# Altium schematic sheet [1] Conn_SODIMM.SchDoc
size A2 portrait; Organization: Altium Limited; Address1: L3, 12a Rodborough Rd; Address2: Frenchs Forest; Address3: NSW; Address4: Australia 2086
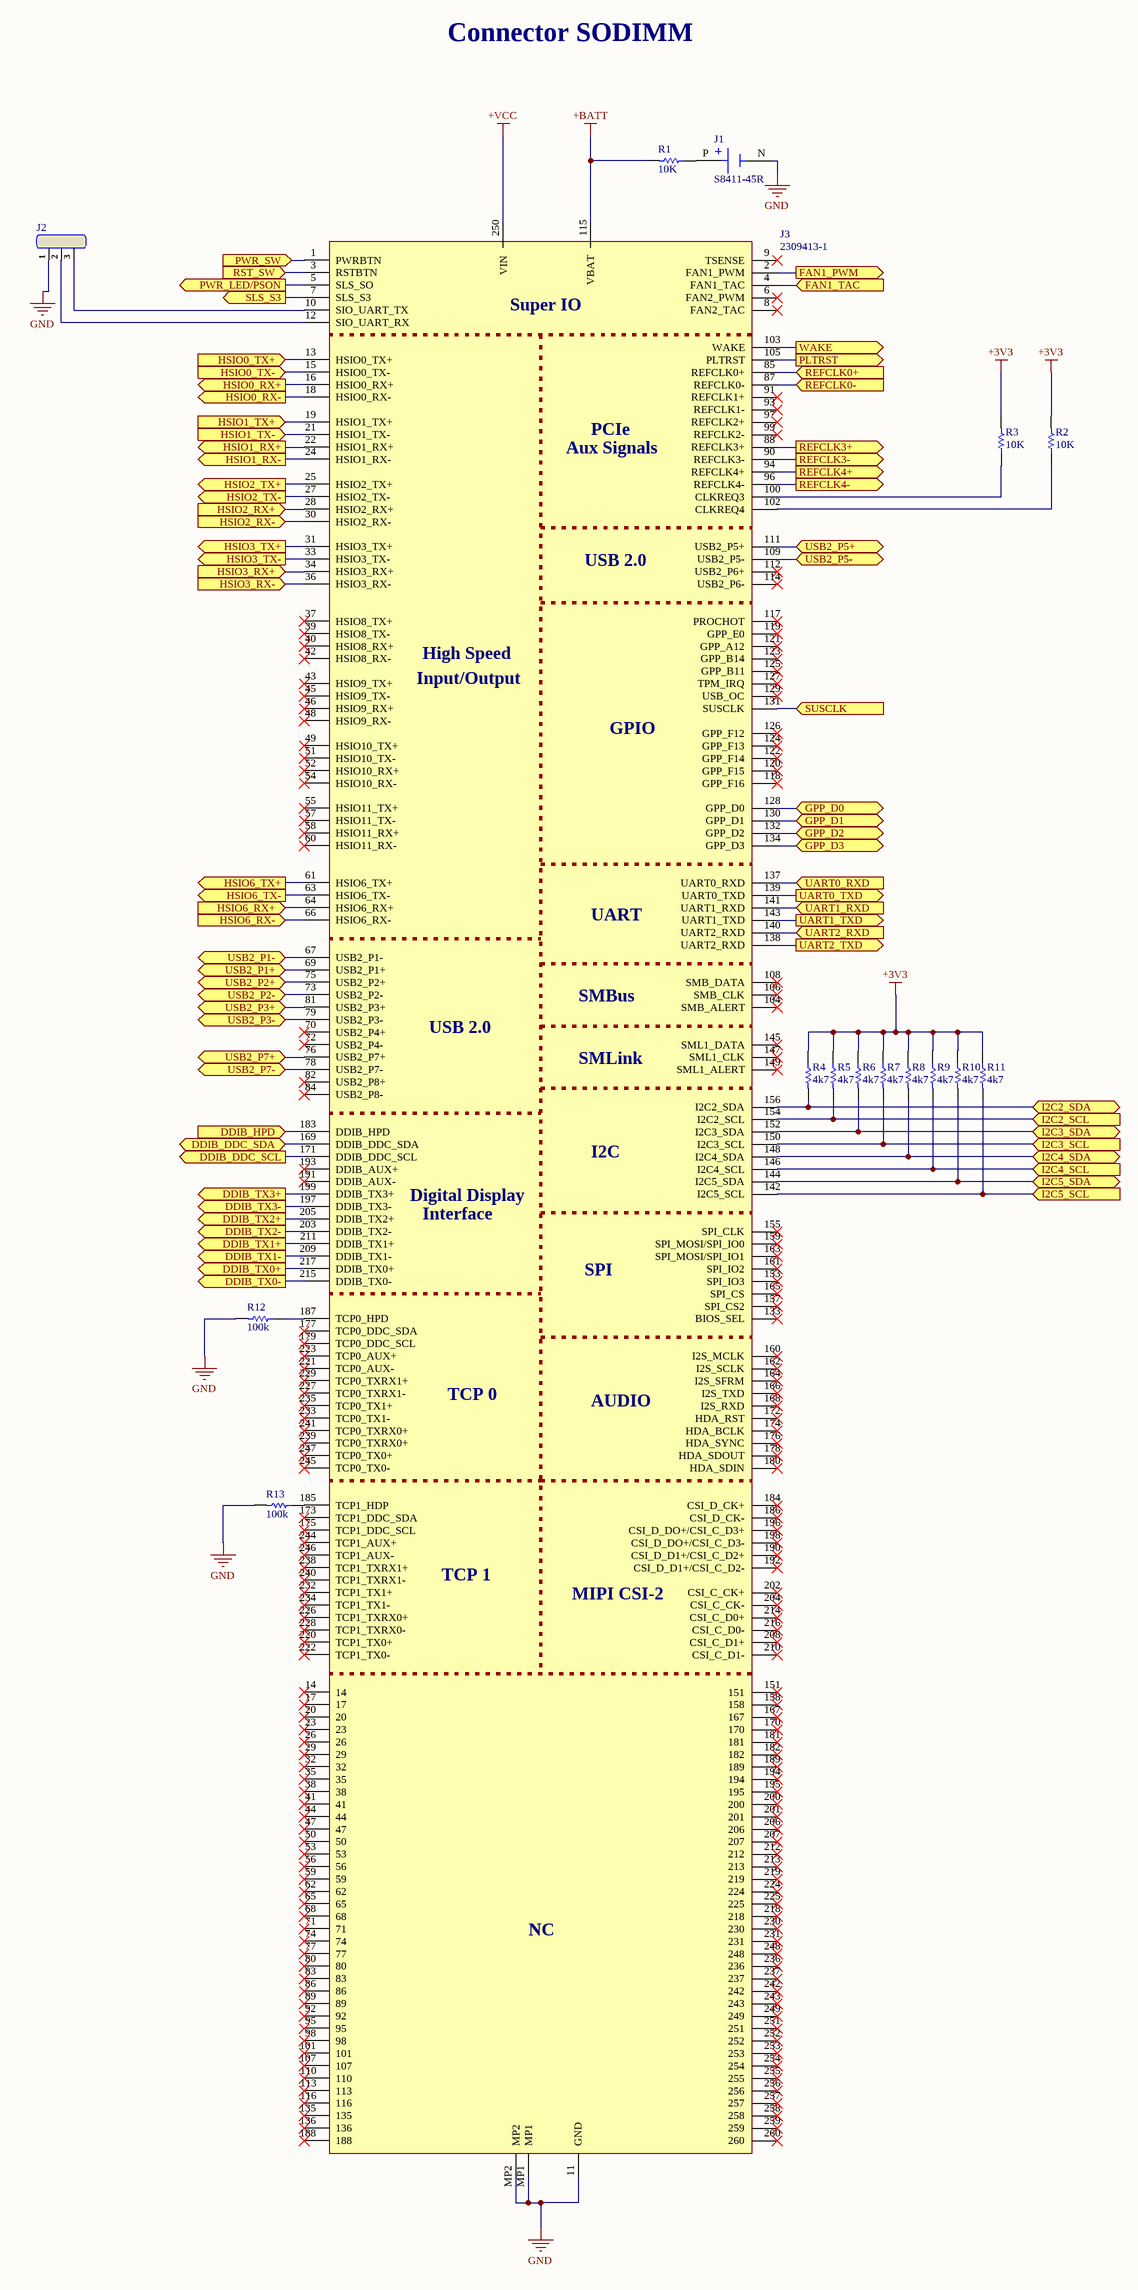
[diagram p0: [1] Conn_SODIMM.SchDoc]

## Parts
J1  S8411-45R  [HARWIN_S8411-45R]
J2  Header 3x1  [HM 3X1]  (value not drawn)
J3  2309413-1  [23094131]
R1  10K  [Resistencia 0402]
R2  10K  [Resistencia 0402]
R3  10K  [Resistencia 0402]
R4  4k7  [Resistencia 0402]
R5  4k7  [Resistencia 0402]
R6  4k7  [Resistencia 0402]
R7  4k7  [Resistencia 0402]
R8  4k7  [Resistencia 0402]
R9  4k7  [Resistencia 0402]
R10  4k7  [Resistencia 0402]
R11  4k7  [Resistencia 0402]
R12  100k  [Resistencia 0402]
R13  100k  [Resistencia 0402]

## Ports
DDIB_DDC_SCL (out), DDIB_DDC_SDA (bidir), DDIB_HPD (in), DDIB_TX0+ (out), DDIB_TX0- (out), DDIB_TX1+ (out), DDIB_TX1- (out), DDIB_TX2+ (out), DDIB_TX2- (out), DDIB_TX3+ (out), DDIB_TX3- (out), FAN1_PWM (out), FAN1_TAC (in), GPP_D0 (bidir), GPP_D1 (bidir), GPP_D2 (bidir), GPP_D3 (bidir), HSIO0_RX+ (out), HSIO0_RX- (out), HSIO0_TX+ (in), HSIO0_TX- (in), HSIO1_RX+ (out), HSIO1_RX- (out), HSIO1_TX+ (in), HSIO1_TX- (in), HSIO2_RX+ (in), HSIO2_RX- (in), HSIO2_TX+ (out), HSIO2_TX- (out), HSIO3_RX+ (in), HSIO3_RX- (in), HSIO3_TX+ (out), HSIO3_TX- (out), HSIO6_RX+ (in), HSIO6_RX- (in), HSIO6_TX+ (out), HSIO6_TX- (out), I2C2_SCL (in), I2C2_SDA (bidir), I2C3_SCL (in), I2C3_SDA (bidir), I2C4_SCL (in), I2C4_SDA (bidir), I2C5_SCL (in), I2C5_SDA (bidir), PLTRST (out), PWR_LED/PSON (out), PWR_SW (in), REFCLK0+ (in), REFCLK0- (in), REFCLK3+ (out), REFCLK3- (out), REFCLK4+ (out), REFCLK4- (out), RST_SW (in), SLS_S3 (out), SUSCLK (in), UART0_RXD (in), UART0_TXD (out), UART1_RXD (in), UART1_TXD (out), UART2_RXD (in), UART2_TXD (out), USB2_P1+ (bidir), USB2_P1- (bidir), USB2_P2+ (bidir), USB2_P2- (bidir), USB2_P3+ (bidir), USB2_P3- (bidir), USB2_P5+ (bidir), USB2_P5- (bidir), USB2_P7+ (bidir), USB2_P7- (bidir), WAKE (out)

## Nets
+3V3: R2.1(A) R3.1(A) R4.2(B) R5.2(B) R6.2(B) R7.2(B) R8.2(B) R9.2(B) R10.2(B) R11.2(B)
+BATT: J3.115(VBAT) R1.1(A)
+VCC: J3.250(VIN)
GND: J1.N(NEG) J2.1 J3.11(GND) J3.MP1 J3.MP2 R12.1(A) R13.1(A)
DDIB_DDC_SCL: J3.171(DDIB_DDC_SCL) ; port DDIB_DDC_SCL
DDIB_DDC_SDA: J3.169(DDIB_DDC_SDA) ; port DDIB_DDC_SDA
DDIB_HPD: J3.183(DDIB_HPD) ; port DDIB_HPD
DDIB_TX0+: J3.217(DDIB_TX0+) ; port DDIB_TX0+
DDIB_TX0-: J3.215(DDIB_TX0-) ; port DDIB_TX0-
DDIB_TX1+: J3.211(DDIB_TX1+) ; port DDIB_TX1+
DDIB_TX1-: J3.209(DDIB_TX1-) ; port DDIB_TX1-
DDIB_TX2+: J3.205(DDIB_TX2+) ; port DDIB_TX2+
DDIB_TX2-: J3.203(DDIB_TX2-) ; port DDIB_TX2-
DDIB_TX3+: J3.199(DDIB_TX3+) ; port DDIB_TX3+
DDIB_TX3-: J3.197(DDIB_TX3-) ; port DDIB_TX3-
FAN1_PWM: J3.2(FAN1_PWM) ; port FAN1_PWM
FAN1_TAC: J3.4(FAN1_TAC) ; port FAN1_TAC
GPP_D0: J3.128(GPP_D0) ; port GPP_D0
GPP_D1: J3.130(GPP_D1) ; port GPP_D1
GPP_D2: J3.132(GPP_D2) ; port GPP_D2
GPP_D3: J3.134(GPP_D3) ; port GPP_D3
HSIO0_RX+: J3.16(HSIO0_RX+) ; port HSIO0_RX+
HSIO0_RX-: J3.18(HSIO0_RX-) ; port HSIO0_RX-
HSIO0_TX+: J3.13(HSIO0_TX+) ; port HSIO0_TX+
HSIO0_TX-: J3.15(HSIO0_TX-) ; port HSIO0_TX-
HSIO1_RX+: J3.22(HSIO1_RX+) ; port HSIO1_RX+
HSIO1_RX-: J3.24(HSIO1_RX-) ; port HSIO1_RX-
HSIO1_TX+: J3.19(HSIO1_TX+) ; port HSIO1_TX+
HSIO1_TX-: J3.21(HSIO1_TX-) ; port HSIO1_TX-
HSIO2_RX+: J3.28(HSIO2_RX+) ; port HSIO2_RX+
HSIO2_RX-: J3.30(HSIO2_RX-) ; port HSIO2_RX-
HSIO2_TX+: J3.25(HSIO2_TX+) ; port HSIO2_TX+
HSIO2_TX-: J3.27(HSIO2_TX-) ; port HSIO2_TX-
HSIO3_RX+: J3.34(HSIO3_RX+) ; port HSIO3_RX+
HSIO3_RX-: J3.36(HSIO3_RX-) ; port HSIO3_RX-
HSIO3_TX+: J3.31(HSIO3_TX+) ; port HSIO3_TX+
HSIO3_TX-: J3.33(HSIO3_TX-) ; port HSIO3_TX-
HSIO6_RX+: J3.64(HSIO6_RX+) ; port HSIO6_RX+
HSIO6_RX-: J3.66(HSIO6_RX-) ; port HSIO6_RX-
HSIO6_TX+: J3.61(HSIO6_TX+) ; port HSIO6_TX+
HSIO6_TX-: J3.63(HSIO6_TX-) ; port HSIO6_TX-
I2C2_SCL: J3.154(I2C2_SCL) R5.1(A) ; port I2C2_SCL
I2C2_SDA: J3.156(I2C2_SDA) R4.1(A) ; port I2C2_SDA
I2C3_SCL: J3.150(I2C3_SCL) R7.1(A) ; port I2C3_SCL
I2C3_SDA: J3.152(I2C3_SDA) R6.1(A) ; port I2C3_SDA
I2C4_SCL: J3.146(I2C4_SCL) R9.1(A) ; port I2C4_SCL
I2C4_SDA: J3.148(I2C4_SDA) R8.1(A) ; port I2C4_SDA
I2C5_SCL: J3.142(I2C5_SCL) R11.1(A) ; port I2C5_SCL
I2C5_SDA: J3.144(I2C5_SDA) R10.1(A) ; port I2C5_SDA
PLTRST: J3.105(PLTRST) ; port PLTRST
PWR_LED/PSON: J3.5(SLS_SO) ; port PWR_LED/PSON
PWR_SW: J3.1(PWRBTN) ; port PWR_SW
REFCLK0+: J3.85(REFCLK0+) ; port REFCLK0+
REFCLK0-: J3.87(REFCLK0-) ; port REFCLK0-
REFCLK3+: J3.88(REFCLK3+) ; port REFCLK3+
REFCLK3-: J3.90(REFCLK3-) ; port REFCLK3-
REFCLK4+: J3.94(REFCLK4+) ; port REFCLK4+
REFCLK4-: J3.96(REFCLK4-) ; port REFCLK4-
RST_SW: J3.3(RSTBTN) ; port RST_SW
SLS_S3: J3.7(SLS_S3) ; port SLS_S3
SUSCLK: J3.131(SUSCLK) ; port SUSCLK
UART0_RXD: J3.137(UART0_RXD) ; port UART0_RXD
UART0_TXD: J3.139(UART0_TXD) ; port UART0_TXD
UART1_RXD: J3.141(UART1_RXD) ; port UART1_RXD
UART1_TXD: J3.143(UART1_TXD) ; port UART1_TXD
UART2_RXD: J3.140(UART2_RXD) ; port UART2_RXD
UART2_TXD: J3.138(UART2_RXD) ; port UART2_TXD
USB2_P1+: J3.69(USB2_P1+) ; port USB2_P1+
USB2_P1-: J3.67(USB2_P1-) ; port USB2_P1-
USB2_P2+: J3.75(USB2_P2+) ; port USB2_P2+
USB2_P2-: J3.73(USB2_P2-) ; port USB2_P2-
USB2_P3+: J3.81(USB2_P3+) ; port USB2_P3+
USB2_P3-: J3.79(USB2_P3-) ; port USB2_P3-
USB2_P5+: J3.111(USB2_P5+) ; port USB2_P5+
USB2_P5-: J3.109(USB2_P5-) ; port USB2_P5-
USB2_P7+: J3.76(USB2_P7+) ; port USB2_P7+
USB2_P7-: J3.78(USB2_P7-) ; port USB2_P7-
WAKE: J3.103(WAKE) ; port WAKE
NetJ1_P: J1.P(POS) R1.2(B)
NetJ2_2: J2.2 J3.12(SIO_UART_RX)
NetJ2_3: J2.3 J3.10(SIO_UART_TX)
NetJ3_100: J3.100(CLKREQ3) R3.2(B)
NetJ3_102: J3.102(CLKREQ4) R2.2(B)
NetJ3_185: J3.185(TCP1_HDP) R13.2(B)
NetJ3_187: J3.187(TCP0_HPD) R12.2(B)

Not connected (* = marked no-connect by the designer): J3 6(FAN2_PWM)* 8(FAN2_TAC)* 9(TSENSE)* 14* 17* 20* 23* 26* 29* 32* 35* 37(HSIO8_TX+)* 38* 39(HSIO8_TX-)* 40(HSIO8_RX+)* 41* 42(HSIO8_RX-)* 43(HSIO9_TX+)* 44* 45(HSIO9_TX-)* 46(HSIO9_RX+)* 47* 48(HSIO9_RX-)* 49(HSIO10_TX+)* 50* 51(HSIO10_TX-)* 52(HSIO10_RX+)* 53* 54(HSIO10_RX-)* 55(HSIO11_TX+)* 56* 57(HSIO11_TX-)* 58(HSIO11_RX+)* 59* 60(HSIO11_RX-)* 62* 65* 68* 70(USB2_P4+)* 71* 72(USB2_P4-)* 74* 77* 80* 82(USB2_P8+)* 83* 84(USB2_P8-)* 86* 89* 91(REFCLK1+)* 92* 93(REFCLK1-)* 95* 97(REFCLK2+)* 98* 99(REFCLK2-)* 101* 104(SMB_ALERT)* 106(SMB_CLK)* 107* 108(SMB_DATA)* 110* 112(USB2_P6+)* 113* 114(USB2_P6-)* 116* 117(PROCHOT)* 118(GPP_F16)* 119(GPP_E0)* 120(GPP_F15)* 121(GPP_A12)* 122(GPP_F14)* 123(GPP_B14)* 124(GPP_F13)* 125(GPP_B11)* 126(GPP_F12)* 127(TPM_IRQ)* 129(USB_OC)* 133(BIOS_SEL)* 135* 136* 145(SML1_DATA)* 147(SML1_CLK)* 149(SML1_ALERT)* 151* 153(SPI_IO3)* 155(SPI_CLK)* 157(SPI_CS2)* 158* 159(SPI_MOSI/SPI_IO0)* 160(I2S_MCLK)* 161(SPI_IO2)* 162(I2S_SCLK)* 163(SPI_MOSI/SPI_IO1)* 164(I2S_SFRM)* 165(SPI_CS)* 166(I2S_TXD)* 167* 168(I2S_RXD)* 170* 172(HDA_RST)* 173(TCP1_DDC_SDA)* 174(HDA_BCLK)* 175(TCP1_DDC_SCL)* 176(HDA_SYNC)* 177(TCP0_DDC_SDA)* 178(HDA_SDOUT)* 179(TCP0_DDC_SCL)* 180(HDA_SDIN)* 181* 182* 184(CSI_D_CK+)* 186(CSI_D_CK-)* 188* 189* 190(CSI_D_D1+/CSI_C_D2+)* 191(DDIB_AUX-)* 192(CSI_D_D1+/CSI_C_D2-)* 193(DDIB_AUX+)* 194* 195* 196(CSI_D_DO+/CSI_C_D3+)* 198(CSI_D_DO+/CSI_C_D3-)* 200* 201* 202(CSI_C_CK+)* 204(CSI_C_CK-)* 206* 207* 208(CSI_C_D1+)* 210(CSI_C_D1-)* 212* 213* 214(CSI_C_D0+)* 216(CSI_C_D0-)* 218* 219* 220(TCP1_TX0+)* 221(TCP0_AUX-)* 222(TCP1_TX0-)* 223(TCP0_AUX+)* 224* 225* 226(TCP1_TXRX0+)* 227(TCP0_TXRX1-)* 228(TCP1_TXRX0-)* 229(TCP0_TXRX1+)* 230* 231* 232(TCP1_TX1+)* 233(TCP0_TX1-)* 234(TCP1_TX1-)* 235(TCP0_TX1+)* 236* 237* 238(TCP1_TXRX1+)* 239(TCP0_TXRX0+)* 240(TCP1_TXRX1-)* 241(TCP0_TXRX0+)* 242* 243* 244(TCP1_AUX+)* 245(TCP0_TX0-)* 246(TCP1_AUX-)* 247(TCP0_TX0+)* 248* 249* 251* 252* 253* 254* 255* 256* 257* 258* 259* 260*

## Notes on the sheet
- Connector SODIMM
- Title
- Size:
- Date:
- File:
- A2
- Number:
- Time:
- Revision:
- Sheet
- of
- (in symbol 2309413-1) Super IO; PCIe; Aux Signals; USB 2.0; High Speed; Input/Output; GPIO; UART; SMBus; SMLink; I2C; Digital Display; Interface; SPI; TCP 0; AUDIO; TCP 1; MIPI CSI-2; NC

## Library data of the parts
J1 = S8411-45R: Coin Cell Battery Retainer, Horizontal SMT, for CR1220 Coin Cell Batteries, Tape & Reeled; MF: Harwin; SnapEDA_Link: https://www.snapeda.com/parts/S8411-45R/Harwin+Inc./view-part/?ref=snap; Package: None; Value: *; MP: S8411-45R; Check_prices: https://www.snapeda.com/parts/S8411-45R/Harwin+Inc./view-part/?ref=eda
J2 = HM 3x1: Header Macho 3x1 2.54mm
J3 = 2309413-1: Body Features: Module Key Type Offset Left; Manufacturer_Name: TE Connectivity; Geometry.Height: 9.45mm; Mouser Part Number: 571-2309413-1; Mouser Price/Stock: https://www.mouser.co.uk/ProductDetail/TE-Connectivity/2309413-1?qs=1mbolxNpo8ckNkoYMswDaw%3D%3D; Manufacturer_Part_Number: 2309413-1; Datasheet Link: https://www.te.com/commerce/DocumentDelivery/DDEController?Action=showdoc&DocId=Customer+Drawing%7F2309413%7F3%7Fpdf%7FEnglish%7FENG_CD_2309413_3.pdf%7F2309413-1
R1-R13 = Resistencia SMD 0402